# Altium schematic sheet BLT.SchDoc
size A4; SheetNumber: 4; SheetTotal: 7
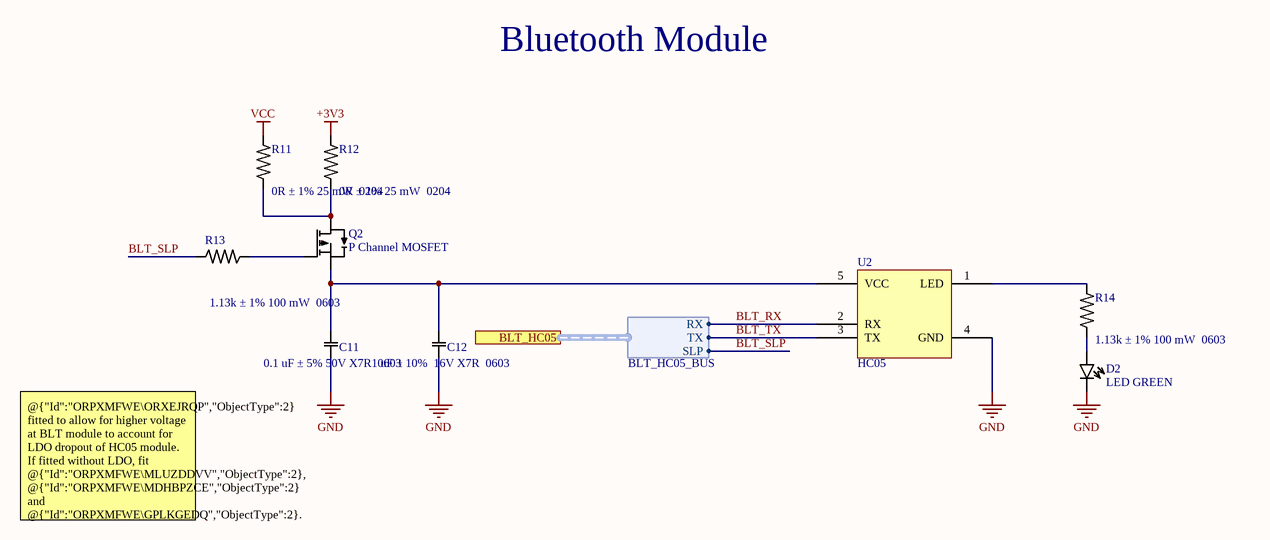
[diagram p0: BLT.SchDoc]

## Parts
C11  0.1 uF ± 5% / 50V X7R / 0603  [0603_CAP]
C12  1 uF ± 10% / 16V X7R / 0603  [0603_CAP]
D2  LED GREEN  [LED]
Q2  P Channel MOSFET  [SOT23-3]
R11  0R ± 1% / 25 mW / 0204  [0603_RES]
R12  0R ± 1% / 25 mW / 0204  [0603_RES]
R13  1.13k ± 1% / 100 mW / 0603  [0603_RES]
R14  1.13k ± 1% / 100 mW / 0603  [0603_RES]
U2  HC05  [HC05]

## Ports
BLT_HC05 (harness BLT_HC05_BUS, see Game_Controller[3B], MCU[3C])

## Harnesses
BLT_HC05_BUS: RX, TX, SLP

## Nets
+3V3: R12.2
GND: C11.2 C12.2 D2.2(K) U2.4(GND)
VCC: R11.2
BLT_RX: U2.2(RX) ; port BLT_HC05.RX
BLT_SLP: R13.2 ; port BLT_HC05.SLP
BLT_TX: U2.3(TX) ; port BLT_HC05.TX
NetC11_1: C11.1 C12.1 Q2.2(S) U2.5(VCC)
NetD2_1: D2.1(A) R14.1
NetQ2_1: Q2.1(G) R13.1
NetQ2_3: Q2.3(D) R11.1 R12.1
NetR14_2: R14.2 U2.1(LED)

## Notes on the sheet
- Bluetooth Module
- @{"Id":"ORPXMFWE\ORXEJRQP","ObjectType":2} fitted to allow for higher voltage at BLT module to account for LDO dropout of HC05 module. If fitted without LDO, fit @{"Id":"ORPXMFWE\MLUZDDVV","ObjectType":2}, @{"Id":"ORPXMFWE\MDHBPZCE","ObjectType":2} and @{"Id":"ORPXMFWE\GPLKGEDQ","ObjectType":2}.

## Library data of the parts
C11 = 3: Manufacturer: Yageo; Manufacturer Part Number: CC0603JRX7R9BB104; CID: 3
C12 = 5: Manufacturer: Yageo; Manufacturer Part Number: GXT188R71C105KE13D; CID: 5
D2 = 11: Manufacturer: Lite-ON; Manufacturer Part Number: LTST-C190GKT; CID: 11
Q2 = 28: Manufacturer: Vishay; CID: 28; Manufacturer Part Number: SI2301CDS-T1-E3
R11 R12 = 24: Manufacturer: Vishay; Manufacturer Part Number: None; CID: 24
R13 R14 = 10: Manufacturer: Yageo; Manufacturer Part Number: RC0603FR-071K13L; CID: 10
U2 = 19: HC05 Bluetooth Module; Manufacturer: ETSG; CID: 19; Manufacturer Part Number: HC05